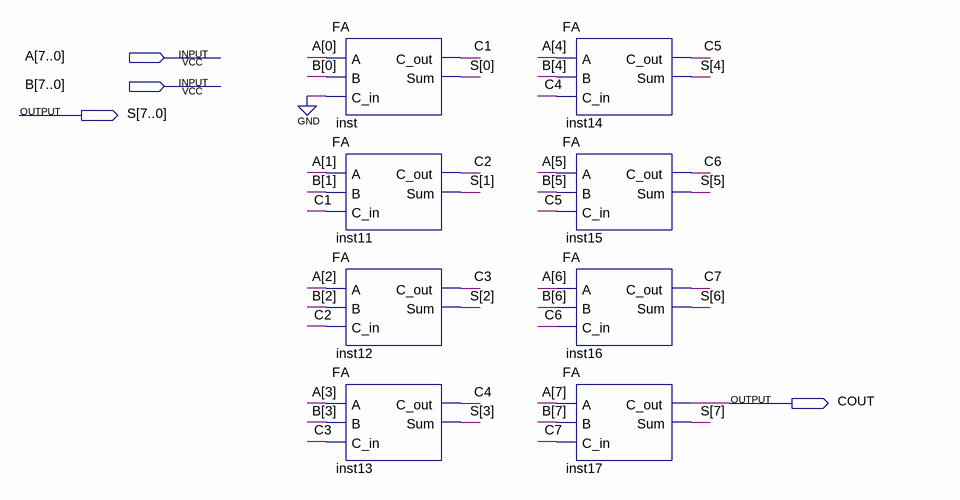
[diagram p0: schematic sheet]
// Quartus schematic 8bit-FA.bdf as structural Verilog: 8 symbols, 4 pins
module \8bit-FA  (
  input  [7:0] A,
  input  [7:0] B,
  output [7:0] S,
  output COUT
);

  wire C1, C2, C3, C4, C5, C6, C7;

  FA inst (.A(A[0]), .B(B[0]), .C_in(1'b0), .C_out(C1), .Sum(S[0]));
  FA inst11 (.A(A[1]), .B(B[1]), .C_in(C1), .C_out(C2), .Sum(S[1]));
  FA inst12 (.A(A[2]), .B(B[2]), .C_in(C2), .C_out(C3), .Sum(S[2]));
  FA inst13 (.A(A[3]), .B(B[3]), .C_in(C3), .C_out(C4), .Sum(S[3]));
  FA inst14 (.A(A[4]), .B(B[4]), .C_in(C4), .C_out(C5), .Sum(S[4]));
  FA inst15 (.A(A[5]), .B(B[5]), .C_in(C5), .C_out(C6), .Sum(S[5]));
  FA inst16 (.A(A[6]), .B(B[6]), .C_in(C6), .C_out(C7), .Sum(S[6]));
  FA inst17 (.A(A[7]), .B(B[7]), .C_in(C7), .C_out(COUT), .Sum(S[7]));
endmodule
